# Altium schematic sheet RFR_Project.SchDoc
size A
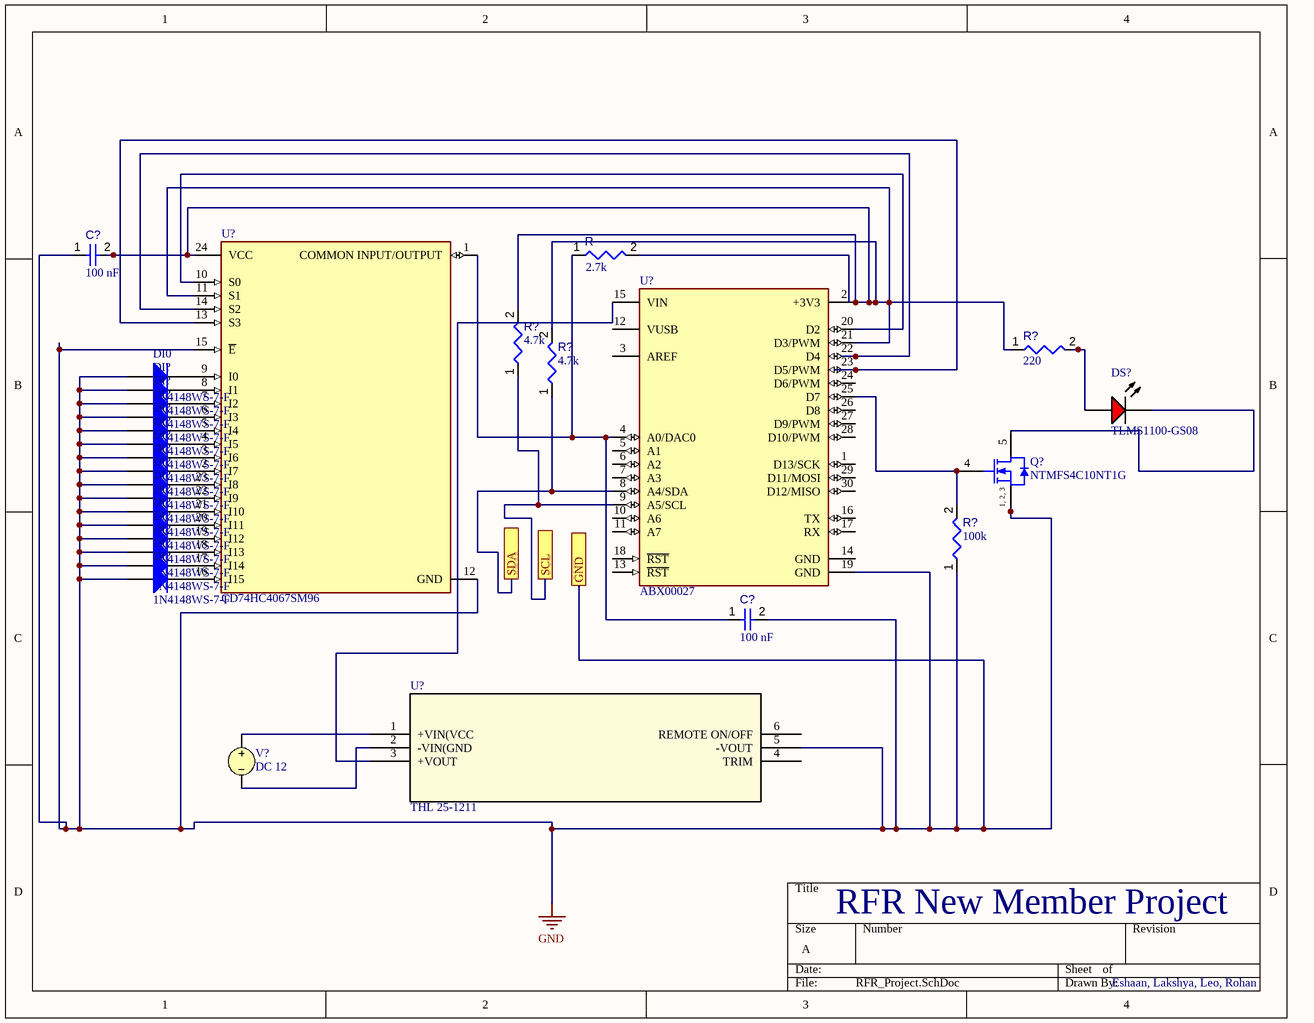
[diagram p0: RFR_Project.SchDoc]

## Parts
(Parts that share a designator on the sheet are numbered #1, #2 ... from top to bottom, then left to right.)
C?#1  value 100 nF  [CAPC1608X90X40LL10T20]  (hidden comment: Capacitor 1 uF +/- 10% 25 V 0603)
C?#2  value 100 nF  [CAPC1608X90X40LL10T20]  (hidden comment: Capacitor 1 uF +/- 10% 25 V 0603)
DI0  1N4148WS-7-F  [DIOD-SOD323-2-A_V]
DI?#1  1N4148WS-7-F  [DIOD-SOD323-2-A_V]
DI?#2  1N4148WS-7-F  [DIOD-SOD323-2-A_V]
DI?#3  1N4148WS-7-F  [DIOD-SOD323-2-A_V]
DI?#4  1N4148WS-7-F  [DIOD-SOD323-2-A_V]
DI?#5  1N4148WS-7-F  [DIOD-SOD323-2-A_V]
DI?#6  1N4148WS-7-F  [DIOD-SOD323-2-A_V]
DI?#7  1N4148WS-7-F  [DIOD-SOD323-2-A_V]
DI?#8  1N4148WS-7-F  [DIOD-SOD323-2-A_V]
DI?#9  1N4148WS-7-F  [DIOD-SOD323-2-A_V]
DI?#10  1N4148WS-7-F  [DIOD-SOD323-2-A_V]
DI?#11  1N4148WS-7-F  [DIOD-SOD323-2-A_V]
DI?#12  1N4148WS-7-F  [DIOD-SOD323-2-A_V]
DI?#13  1N4148WS-7-F  [DIOD-SOD323-2-A_V]
DI?#14  1N4148WS-7-F  [DIOD-SOD323-2-A_V]
DI?#15  1N4148WS-7-F  [DIOD-SOD323-2-A_V]
DS?  TLMS1100-GS08  [VISH-TLMX1100_V]
Q?  NTMFS4C10NT1G  [ONSC-DFN-5-488AA_V]
R  R_bias: 2.7k  [RESC0402(1005)_L]  (hidden comment: 12KR2F)
R?#1  value 220  [RESC0402(1005)_L]  (hidden comment: 12KR2F)
R?#2  value 4.7k  [RESC0402(1005)_L]  (hidden comment: 120KR2F)
R?#3  value 4.7k  [RESC0402(1005)_L]  (hidden comment: 120KR2F)
R?#4  value 100k  [RESC0402(1005)_L]  (hidden comment: 12KR2F)
U?#1  CD74HC4067SM96  [FP-DB0024A-IPC_C]
U?#2  ABX00027  [FP-ABX00027-MFG]
U?#3  THL 25-1211  [THL 25 SINGLE_TRP]
V?  DC 12

## Ports
GND, SCL, SDA

## Nets
GND: C?#1.1 C?#2.2 DI0.1(A) DI?#1.1(A) DI?#2.1(A) DI?#3.1(A) DI?#4.1(A) DI?#5.1(A) DI?#6.1(A) DI?#7.1(A) DI?#8.1(A) DI?#9.1(A) DI?#10.1(A) DI?#11.1(A) DI?#12.1(A) DI?#13.1(A) DI?#14.1(A) DI?#15.1(A) Q?.1(S) Q?.2(S) Q?.3(S) R?#4.1 U?#1.12(GND) U?#1.15(~{E}) U?#2.19(GND) U?#3.5(-VOUT) ; port GND
SCL: R?#2.1 U?#2.9(A5/SCL) ; port SCL
SDA: R?#3.1 U?#2.8(A4/SDA) ; port SDA
NetC?#1_2: C?#1.2 R?#1.1 R?#2.2 R?#3.2 U?#1.11(S1) U?#1.24(VCC) U?#2.2(+3V3) U?#2.21(D3/PWM)
NetC?#2_1: C?#2.1 R.1 U?#1.1(COMMON_INPUT/OUTPUT) U?#2.4(A0/DAC0)
NetDI0_2: DI0.2(K) U?#1.9(I0)
NetDI?#1_2: DI?#1.2(K) U?#1.8(I1)
NetDI?#2_2: DI?#2.2(K) U?#1.7(I2)
NetDI?#3_2: DI?#3.2(K) U?#1.6(I3)
NetDI?#4_2: DI?#4.2(K) U?#1.5(I4)
NetDI?#5_2: DI?#5.2(K) U?#1.4(I5)
NetDI?#6_2: DI?#6.2(K) U?#1.3(I6)
NetDI?#7_2: DI?#7.2(K) U?#1.2(I7)
NetDI?#8_2: DI?#8.2(K) U?#1.23(I8)
NetDI?#9_2: DI?#9.2(K) U?#1.22(I9)
NetDI?#10_2: DI?#10.2(K) U?#1.21(I10)
NetDI?#11_2: DI?#11.2(K) U?#1.20(I11)
NetDI?#12_2: DI?#12.2(K) U?#1.19(I12)
NetDI?#13_2: DI?#13.2(K) U?#1.18(I13)
NetDI?#14_2: DI?#14.2(K) U?#1.17(I14)
NetDI?#15_2: DI?#15.2(K) U?#1.16(I15)
NetDS?_1: DS?.1(A) R?#1.2
NetDS?_2: DS?.2(K) Q?.5(D)
NetQ?_4: Q?.4(G) R?#4.2 U?#2.25(D7)
NetU?#1_10: U?#1.10(S0) U?#2.20(D2)
NetU?#1_13: U?#1.13(S3) U?#2.23(D5/PWM)
NetU?#1_14: U?#1.14(S2) U?#2.22(D4)
NetU?#2_15: U?#2.15(VIN) U?#3.3(+VOUT)
NetU?#3_1: U?#3.1(+VIN(VCC) V?.1
NetU?#3_2: U?#3.2(-VIN(GND) V?.2

Not connected (* = marked no-connect by the designer): R 2; U?#2 1(D13/SCK) 3(AREF) 5(A1) 6(A2) 7(A3) 10(A6) 11(A7) 12(VUSB) 13(~{RST}) 14(GND) 16(TX) 17(RX) 18(~{RST}) 24(D6/PWM) 26(D8) 27(D9/PWM) 28(D10/PWM) 29(D11/MOSI) 30(D12/MISO); U?#3 4(TRIM) 6(REMOTE_ON/OFF)

## Notes on the sheet
- RFR New Member Project
- Eshaan, Lakshya, Leo, Rohan
- (in symbol CMP-1058-00149-1) 1, 2, 3

## Library data of the parts
C?#1 C?#2 = CMP-001-00005-6: Chip Capacitor, 1 uF, +/- 10%, 25 V, 0603 (1608 Metric); Capacitor Type: Ceramic; Voltage Rating: 25V; Pins: 2; Mounting Technology: SM; RoHS Compliant: True; Max Operating Temperature: 125°C; Case/Package: 0603; Min Operating Temperature: -55°C; Tolerance: 10%
DI0 DI?#1-DI?#15 = CMP-004-00002-2: Fast Switching Diode, 75 V, 0.3 A, -65 to 150 degC, 2-Pin SOD323, RoHS, Tape and Reel; Manufacturer: Diodes Inc; Peak Reverse Current: 1uA; Max Surge Current: 2A; Elements: 1; Forward Current: 300mA; Recovery Time: 4ns; Forward Voltage: 1.25V; Datasheet Version: Rev. 25-2, 03/2016; Case/Package: SOD; Min Operating Temperature: -65°C; RoHS Compliant: True; Max Operating Temperature: 150°C; Manufacturer URL: http://www.diodes.com/; Pins: 2; Package Quantity: 3000; Datasheet URL: http://www.diodes.com/datasheets/ds30097.pdf; Packaging: TapeandReel; Package Description: 2-Pin Small Outline Diode, Body 1.7 x 1.3 mm; Mounting Technology: SM; Package Reference: SOD323-2
DS? = CMP-007-00030-2: Red Led, 20mA, 2.1 V, -40 to 100 degC, 2-Pin SMD (0603), RoHS, Tape and Reel; Manufacturer: Vishay Semiconductor; Viewing Angle: 160degrees; Forward Voltage: 2.1V; Lens Style: Clear; Power: 90mW; Luminous Intensity: 63mcd; Datasheet Version: Rev. 2.7, 03/2016; Package Quantity: 3000; Colour: Red; Package Description: 2-Pin Surface Mount Device, Body 1.6 x 0.8 mm; Datasheet URL: http://www.vishay.com/docs/83173/tlmb1100.pdf; Package Reference: TLMX1100; Max Operating Temperature: 100°C; Mounting Technology: SM; Packaging: TapeandReel; Case/Package: 0603; Illumination Colour: Red; Forward Current: 20mA; Manufacturer URL: http://www.vishay.com/; RoHS Compliant: True; Min Operating Temperature: -40°C; Nominal Vf: 2.1V; Pins: 2
Q? = CMP-1058-00149-1: Power MOSFET, 30 V, 46 A, Single N-Channel, 5-Pin DFN, Pb-Free, Tape and Reel; Manufacturer: On Semiconductor; V(BR)DSS Min (V): 30; Ciss Typ (pF): 987; Qrr Typ (nC): 13.7; Channel Polarity: N Channel; VGS Max (V): 20; ID Max (A): 46; Coss Typ (pF): 574; Crss Typ (pF): 162; VGS(th) Max (V): 2.2; PackageVersion: Rev. H, 03/2013; Mounting Technology: Surface Mount; Package Type: SO-8FL; ComponentLink3URL: http://www.onsemi.com/pub_link/Collateral/488AA.PDF; PackageDescription: 5-Pin Small Outline No-Lead, Body 4.9 x 5.9 mm, Pitch 1.27 mm; ComponentLink1Description: Manufacturer URL; PackageReference: DFN-5-488AA; RoHS: Pb-Free; ComponentLink2URL: http://www.onsemi.com/pub_link/Collateral/NTMFS4C10N-D.PDF; DatasheetVersion: Rev. 3; ComponentLink3Description: Package Specification; ComponentLink2Description: Datasheet; PartNumber: NTMFS4C10NT1G; Configuration: Single; Code_JEDEC: MO-240A; Packing: Tape and Reel; ComponentLink1URL: http://www.onsemi.com/
R R?#1 R?#4 = CMP-009-00071-2: 12K 0.063W 1% 0402 (1005 Metric)  SMD; Power: 63mW; Tolerance: 1%; Case/Package: 0402; Mounting Technology: SMT; Pins: 2
R?#2 R?#3 = CMP-009-00068-2: 120K 0.063W 1% 0402 (1005 Metric)  SMD; Power: 63mW; Mounting Technology: SMT; Tolerance: 1%; Case/Package: 0402; Pins: 2
U?#1 = CMP-04892-000038-1: IC MUX/DEMUX 1X16 24SSOP; Supply Type: Single; High Level Output Current: 25mA; Min Supply Voltage: 2V; Number of Circuits: 16; Max Supply Voltage: 6V; Number of Channels: 1; Turn-On Delay Time: 300ns; Max Supply Current: 8uA; Bandwidth: 89MHz; Turn-Off Delay Time: 290ns; Propagation Delay: 75ns; Logic Function: Multiplexer; On-State Resistance: 160R; Polarity: Non-Inverting; Width: 5.3mm; Case/Package: SSOP; Max Operating Temperature: 125°C; Mount: Surface Mount; Min Operating Temperature: -55°C; REACH SVHC: No SVHC; Contact Plating: Gold; Max Output Current: 25mA; Weight: 0.006081oz; Height: 1.95mm; Package Quantity: 2000; Length: 8.2mm; Lead Free: Lead Free; Operating Supply Current: 8uA; Packaging: Tape and Reel; Series: 74HC; Low Level Output Current: 25mA; Number of Outputs: 1; Termination: SMD/SMT; Number of Inputs: 16; Number of Bits: 16; Radiation Hardening: No; Number of Pins: 24
U?#2 = CMP-189990-000001-1: ARDUINO NANO 33 IOT; Number Of Usb Channels: 1; Memory Size: 256KBytes; Interface: I2C,SPI,UART,USB,Other; Number Of Timers/Counters: 5; Memory Type: FLASH; Frequency: 48MHz; Data Bus Width: 32bits; Number Of I/Os: 23; Min Supply Voltage: 4.5V; Core Architecture: ARM Cortex-M0+; Ram Size: 32KBytes; Number Of Adc Channels: 8; Max Supply Voltage: 21V; Manufacturer Part Number: ABX00027; RoHS: TRUE; Automotive: No; Footprint Url: https://content.arduino.cc/assets/Nano33IoT.zip; Number Of A/D Converters: 1; Device Class L3: Microcontrollers; Manufacturer: Arduino; Number Of Spi Channels: 1; Ipc Land Pattern Name: DFN4400X1778X80-30; Category: IC; Number Of Cores: 1; Package: 0; ComponentLink2URL: https://store.arduino.cc/arduino-nano-33-iot; ComponentLink2Description: Datasheet; Digikey Description: ARDUINO NANO 33 IOT; Number Of Uart Channels: 1; Lead Free: Yes; Address Bus Width: 32bits; Device Class L2: Embedded Processors and Controllers; Octopart: https://octopart.com/abx00027-arduino-102769437; Number Of Pwm Channels: 5; Number Of I2C Channels: 1; Device Class L1: Integrated Circuits (ICs)
U?#3 = CMP-01539-38794409-1: THL 25-1211 25 Watt DC/DC converter, industrial, 2: 1 input, encpasulated, 1" x 1" metal package; Output Current: 5A; Efficiency: 89%; Number of Outputs: 1; Output Voltage: 5V; Nominal Input Voltage: 12V; Isolation Voltage: 1.5kV; Max Operating Temperature: 80°C; Length: 25.4mm; RoHS: Compliant; Weight: 16.5g; Mount: Through Hole; Min Operating Temperature: -40°C; NexarPartId: 38794409; Depth: 10.2mm
V? = VSRC: Voltage Source; Note: PCB Footprint - Not required; AC Magnitude: 1; AC Phase: 0; Value: 5; Published: 8-Jun-2000; LatestRevisionDate: 17-Jul-2002; LatestRevisionNote: Re-released for DXP Platform.; PackageReference: Not Applicable; Publisher: Altium Limited